# Altium schematic sheet ConnectorSheet-v1.1.SchDoc
size 420 x 297 mm; SheetNumber: 2; SheetTotal: 3
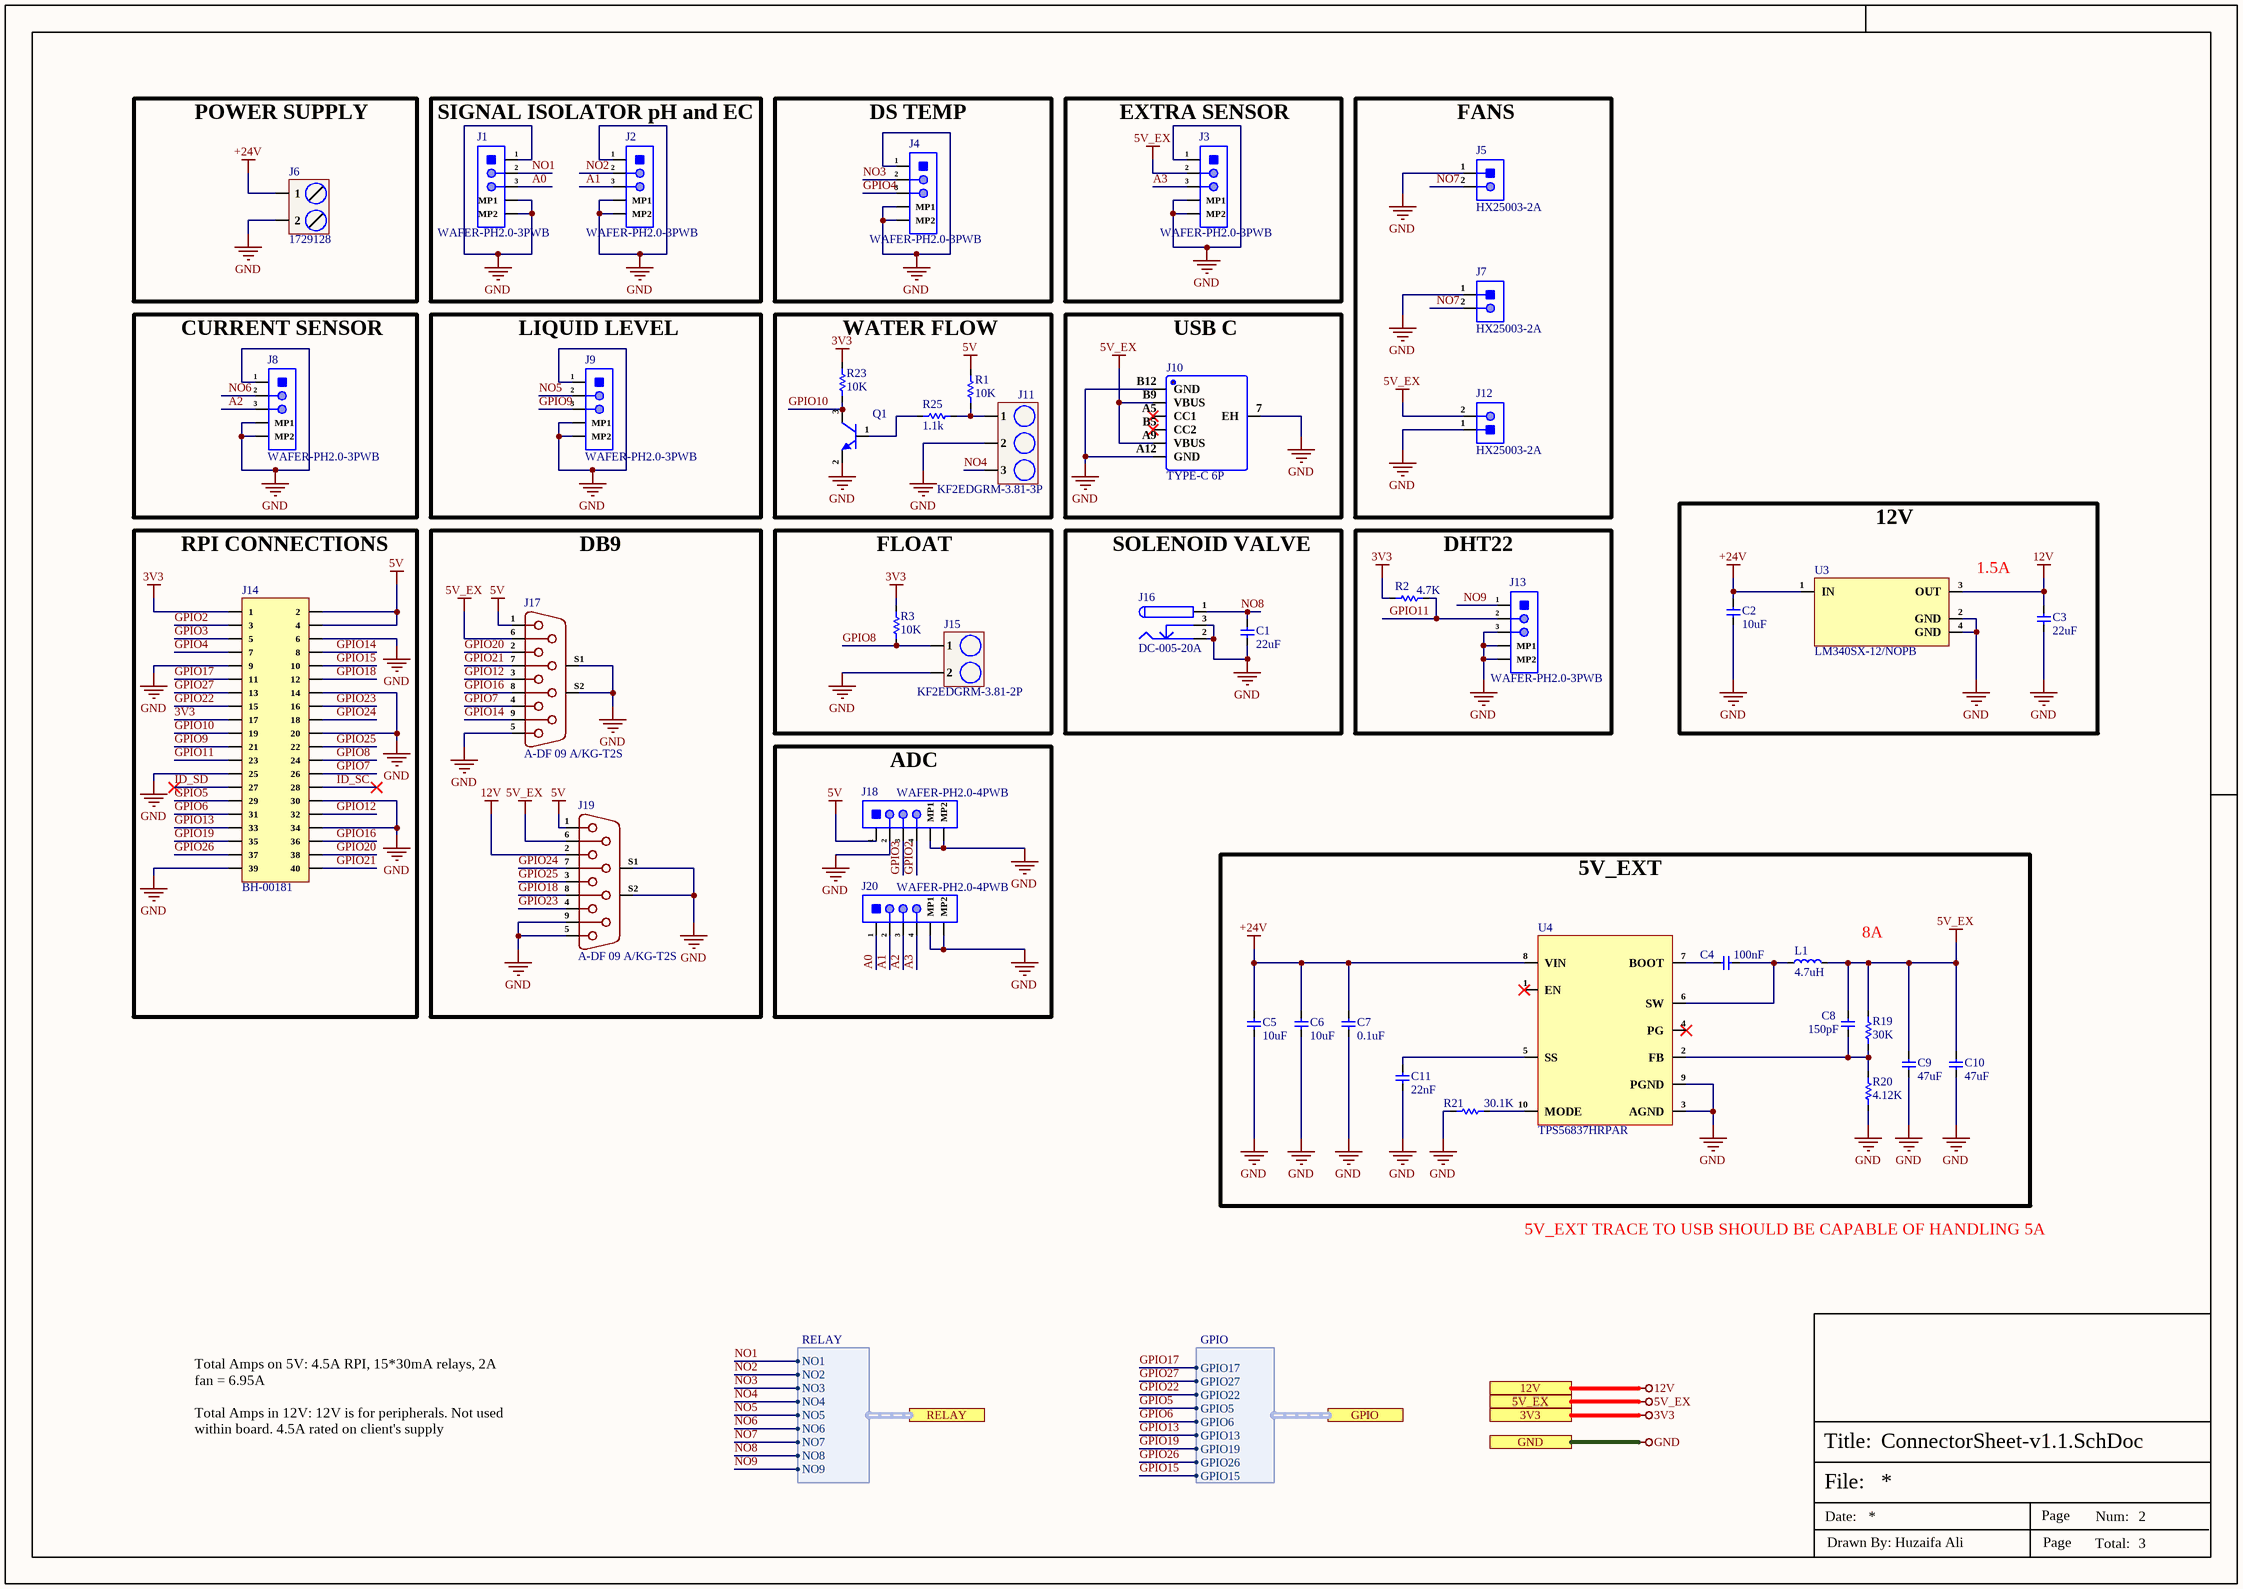
[diagram p0: ConnectorSheet-v1.1.SchDoc]

## Parts
C1  22uF  [Cap-0805]
C2  10uF  [Cap-0805]
C3  22uF  [Cap-0805]
C4  100nF  [cap-0402]
C5  10uF  [Cap-0805]
C6  10uF  [Cap-0805]
C7  0.1uF  [Cap-0402]
C8  150pF  [Cap-0402]
C9  47uF  [Cap-1206]
C10  47uF  [Cap-1206]
C11  22nF  [Cap-0402]
J1  WAFER-PH2.0-3PWB  [WAFER-PH2.0-3PWB]
J2  WAFER-PH2.0-3PWB  [WAFER-PH2.0-3PWB]
J3  WAFER-PH2.0-3PWB  [WAFER-PH2.0-3PWB]
J4  WAFER-PH2.0-3PWB  [WAFER-PH2.0-3PWB]
J5  HX25003-2A  [HX25003-2A]
J6  1729128  [1729128]
J7  HX25003-2A  [HX25003-2A]
J8  WAFER-PH2.0-3PWB  [WAFER-PH2.0-3PWB]
J9  WAFER-PH2.0-3PWB  [WAFER-PH2.0-3PWB]
J10  TYPE-C 6P  [TYPE-C 6P]
J11  KF2EDGRM-3.81-3P  [KF2EDGRM-3.81-3P]
J12  HX25003-2A  [HX25003-2A]
J13  WAFER-PH2.0-3PWB  [WAFER-PH2.0-3PWB]
J14  BH-00181  [BH-00181]
J15  KF2EDGRM-3.81-2P  [KF2EDGRM-3.81-2P]
J16  DC-005-20A  [DC-005-20A]
J17  A-DF 09 A/KG-T2S  [A-DF 09 A/KG-T2S]
J18  WAFER-PH2.0-4PWB  [WAFER-PH2.0-4PWB]
J19  A-DF 09 A/KG-T2S  [A-DF 09 A/KG-T2S]
J20  WAFER-PH2.0-4PWB  [WAFER-PH2.0-4PWB]
L1  4.7uH  [SMD,13.5x12.6mm]
Q1  MMBT2222A-7-F  [SOT-23]  (value not drawn)
R1  10K  [Res-0603]
R2  4.7K  [Res-0603]
R3  10K  [Res-0603]
R19  30K  [Res-0603]
R20  4.12K  [Res-0402]
R21  30.1K  [Res-0402]
R23  10K  [Res-0603]
R25  1.1k  [Res-0603]
U3  LM340SX-12/NOPB  [TO-263 (DDPAK-3)]
U4  TPS56837HRPAR  [10-VQFN-HR (3x3)]

## Blocks framed on the sheet
POWER SUPPLY: J6
SIGNAL ISOLATOR pH and EC: J1 J2
DS TEMP: J4
EXTRA SENSOR: J3
FANS: J5 J7 J12
CURRENT SENSOR: J8
LIQUID LEVEL: J9
WATER FLOW: J11 Q1 R1 R23 R25
USB C: J10
RPI CONNECTIONS: J14
DB9: J17 J19
FLOAT: J15 R3
SOLENOID VALVE: C1 J16
DHT22: J13 R2
12V: C2 C3 U3
ADC: J18 J20
5V_EXT: C4-C11 L1 R19-R21 U4

## Ports
3V3 (see Top-Sheet[2B], RelaySheet-v1.1[4D]), 5V_EX (see Top-Sheet[2B], RelaySheet-v1.1[4D]), 12V (see Top-Sheet[2B], RelaySheet-v1.1[4D]), GND (see Top-Sheet[2B], RelaySheet-v1.1[4D]), GPIO (harness GPIO, see Top-Sheet[2B], RelaySheet-v1.1[4D]), RELAY (harness RELAY, see Top-Sheet[2B], RelaySheet-v1.1[4D])

## Harnesses
GPIO: GPIO17, GPIO27, GPIO22, GPIO5, GPIO6, GPIO13, GPIO19, GPIO26, GPIO15
RELAY: NO2, NO1, NO3, NO4, NO5, NO6, NO7, NO8, NO9

## Nets
3V3: J14.1 J14.17 R2.1 R3.1 R23.1 ; port 3V3
5V: J14.2 J14.4 J17.1 J18.1 J19.1 R1.2
5V_EX: C8.2 C9.2 C10.2 J3.2 J10.A9(VBUS) J10.B9(VBUS) J12.2 J17.6 J19.6 L1.2 R19.2 ; port 5V_EX
12V: C3.2 J19.2 U3.3(OUT) ; port 12V
+24V: C2.2 C5.2 C6.2 C7.2 J6.1 U3.1(IN) U4.8(VIN)
GND: C1.1 C2.1 C3.1 C5.1 C6.1 C7.1 C9.1 C10.1 C11.1 J1.1 J1.MP1 J1.MP2 J2.1 J2.MP1 J2.MP2 J3.1 J3.MP1 J3.MP2 J4.1 J4.MP1 J4.MP2 J5.1 J6.2 J7.1 J8.1 J8.MP1 J8.MP2 J9.1 J9.MP1 J9.MP2 J10.7(EH) J10.A12(GND) J10.B12(GND) J11.2 J12.1 J13.3 J13.MP1 J13.MP2 J14.6 J14.9 J14.14 J14.20 J14.25 J14.30 J14.34 J14.39 J15.2 J16.2 J16.3 J17.5 J17.S1 J17.S2 J18.2 J18.MP1 J18.MP2 J19.5 J19.9 J19.S1 J19.S2 J20.MP1 J20.MP2 Q1.2(E) R20.1 R21.1 U3.2(GND) U3.4(GND) U4.3(AGND) U4.9(PGND) ; port GND
A0: J1.3 J20.1
A1: J2.3 J20.2
A2: J8.3 J20.3
A3: J3.3 J20.4
GPIO2: J14.3 J18.4
GPIO3: J14.5 J18.3
GPIO4: J4.3 J14.7
GPIO5: J14.29 ; port GPIO.GPIO5
GPIO6: J14.31 ; port GPIO.GPIO6
GPIO7: J14.26 J17.4
GPIO8: J14.24 J15.1 R3.2
GPIO9: J9.3 J14.21
GPIO10: J14.19 Q1.3(C) R23.2
GPIO11: J13.2 J14.23 R2.2
GPIO12: J14.32 J17.3
GPIO13: J14.33 ; port GPIO.GPIO13
GPIO14: J14.8 J17.9
GPIO15: J14.10 ; port GPIO.GPIO15
GPIO16: J14.36 J17.8
GPIO17: J14.11 ; port GPIO.GPIO17
GPIO18: J14.12 J19.8
GPIO19: J14.35 ; port GPIO.GPIO19
GPIO20: J14.38 J17.2
GPIO21: J14.40 J17.7
GPIO22: J14.15 ; port GPIO.GPIO22
GPIO23: J14.16 J19.4
GPIO24: J14.18 J19.7
GPIO25: J14.22 J19.3
GPIO26: J14.37 ; port GPIO.GPIO26
GPIO27: J14.13 ; port GPIO.GPIO27
ID_SC: J14.28
ID_SD: J14.27
NO1: J1.2 ; port RELAY.NO1
NO2: J2.2 ; port RELAY.NO2
NO3: J4.2 ; port RELAY.NO3
NO4: J11.3 ; port RELAY.NO4
NO5: J9.2 ; port RELAY.NO5
NO6: J8.2 ; port RELAY.NO6
NO7: J5.2 J7.2 ; port RELAY.NO7
NO8: C1.2 J16.1 ; port RELAY.NO8
NO9: J13.1 ; port RELAY.NO9
NetC4_1: C4.1 U4.7(BOOT)
NetC4_2: C4.2 L1.1 U4.6(SW)
NetC8_1: C8.1 R19.1 R20.2 U4.2(FB)
NetC11_2: C11.2 U4.5(SS)
NetJ11_1: J11.1 R1.1 R25.1
NetQ1_1: Q1.1(B) R25.2
NetR21_2: R21.2 U4.10(MODE)

Not connected (* = marked no-connect by the designer): J10 A5(CC1)* B5(CC2)*; U4 1(EN)* 4(PG)*

## Notes on the sheet
- 1.5A
- (near L1) 8A
- 5V_EXT TRACE TO USB SHOULD BE CAPABLE OF HANDLING 5A
- Total Amps on 5V: 4.5A RPI, 15*30mA relays, 2A fan = 6.95A
  Total Amps in 12V: 12V is for peripherals. Not used within board. 4.5A rated on client's supply
- File:
- Title:
- Date:
- Page
- Num:
- Total:
- Drawn By: Huzaifa Ali

## Library data of the parts
C1 C3 = C2012X5R1V226MT000E: CAP CER 22UF 35V X5R 0805; Manufacturer: TDK Corporation; Item Type: Capacitor; Manufacturer Part Number: C2012X5R1V226MT000E; Package: 0805; ComponentLink1Description: LCSC; ComponentLink1URL: https://www.lcsc.com/product-detail/Multilayer-Ceramic-Capacitors-MLCC-SMD-SMT_TDK-C2012X5R1V226M125AC_C2179409.html; LCSC Part Number: C338080
C2 C5 C6 = GRM21BR61H106ME43L: CAP CER 10UF 50V X5R 0805; Manufacturer: Murata; Supplier 1: Digi-Key; Manufacturer Part Number: GRM21BR61H106ME43L; RoHS: Yes; Category: Ceramic Capacitors; Stock 1: 26; Pricing 1: 1=0.44000, 10=0.30700, 50=0.21500, 100=0.18420, 500=0.13818, 1000=0.11668 (USD); Supplier Part Number 1: 490-18664-1-ND; LCSC Part Number: C2190942
C4 = C1005X7R1H104KT000F: CAP CER 0.1UF 50V X7R 0402; Manufacturer: TDK; Tolerance: 10%; Voltage: 25V; Item Type: Capacitor; Supplier 1: Avnet; Manufacturer Part Number: C1005X7R1H104KT000F; RoHS: No; Category: Ceramic Capacitors; Dielectric: X7R; Supplier Part Number 1: C1005X7R1H104KT000F; LCSC Part Number: C361198; ComponentLink1Description: LCSC; ComponentLink1URL: https://www.lcsc.com/product-detail/Multilayer-Ceramic-Capacitors-MLCC-SMD-SMT_TDK-C1005X7R1H104KT000F_C361198.html
C7 = C1005X5R1H104K050BB: CAP CER 0.1UF 50V X5R 0402; Manufacturer: TDK; Dielectric Material: Ceramic; Capacitance: 100nF; Tolerance: 10%; Item Type: Capacitor; Supplier 1: Digi-Key; Manufacturer Part Number: C1005X5R1H104K050BB; Stock 1: 1455182; Pricing 1: 1=0.12, 10=0.09, 50=0.049, 100=0.04, 500=0.02858, 1000=0.02245, 2500=0.02041, 5000=0.01878 (USD); Mount: Surface Mount; Case/Package: 0402; Case Code (Metric): 1005; Case Code (Imperial): 0402; Weight: 2.3E-05oz; Min Operating Temperature: -55°C; Max Operating Temperature: 85°C; Dielectric: X5R; Voltage Rating: 50V; Packaging: Tape and Reel; Voltage Rating (DC): 50V; Termination: SMD/SMT; Construction: Flat; Package Quantity: 1; Resistor Type: Ceramic; Voltage: 50V; Series: C; Length: 1mm; Width: 0.02inch; Height: 0.5mm; Depth: 0.5mm; Thickness: 0.022inch; Radiation Hardening: No; Lead Free: Lead Free; REACH SVHC: No SVHC; RoHS Compliant: Yes; ComponentLink1URL: https://product.tdk.com/info/en/catalog/spec/mlccspec_commercial_general_midvoltage_en.pdf?src-supplier=Digi-Key; ComponentLink1Description: https://product.tdk.com/info/en/catalog/spec/mlccspec_commercial_general_midvoltage_en.pdf?src-supplier=Digi-Key; ComponentLink2URL: http://www.tdk.co.jp/tefe02/e413_c.pdf?src-supplier=Future+Electronics; ComponentLink2Description: http://www.tdk.co.jp/tefe02/e413_c.pdf?src-supplier=Future+Electronics; ComponentLink3URL: https://www.verical.com/server-webapp/html/getDatasheet?partID=743571&src-supplier=Verical; ComponentLink3Description: https://www.verical.com/server-webapp/html/getDatasheet?partID=743571&src-supplier=Verical; ComponentLink4URL: http://www.tdk.co.jp/tefe02/e412_c.pdf?src-supplier=Avnet+Europe; ComponentLink4Description: http://www.tdk.co.jp/tefe02/e412_c.pdf?src-supplier=Avnet+Europe; Supplier Part Number 1: 445-5942-1-ND; LCSC Part Number: C2181865
C8 = CC0402KRX7R8BB151: CAP CER 150PF 25V X7R 0402; Manufacturer: Yageo; Tolerance: 10%; Item Type: Capacitor; Supplier: Future Electronics; Supplier Part Number: 2069488; Manufacturer Part Number: CC0402KRX7R8BB151; RoHS: Yes; Category: Ceramic Capacitors; Stock: 40000; Pricing: 10000=0.0032, 40000=0.003, 150000=0.0029, 400000=0.0028, 1000000=0.0026 (USD); Mounting Technology: Surface Mount; Case/Package: 0402; Case Code (Imperial): 0402; Case Code (Metric): 1005; Weight: 2.3E-05oz; Min Operating Temperature: -55°C; Max Operating Temperature: 125°C; Value: 150pF; Packaging: Tape and Reel; Voltage Rating (DC): 25V; Dielectric: X7R; Voltage Rating: 25V; Termination: SMD/SMT; Series: CC; Length: 0.039inch; Width: 0.02inch; Thickness: 0.022inch; Lead Free: Lead Free; Halogen Free: Halogen Free; RoHS Compliant: Yes; ComponentLink1URL: https://datasheet.ciiva.com/13210/upy-gphc-x7r-6-3v-to-50v-8-12304-13210062.pdf?src-supplier=Mouser; ComponentLink1Description: https://datasheet.ciiva.com/13210/upy-gphc-x7r-6-3v-to-50v-8-12304-13210062.pdf?src-supplier=Mouser; LCSC Part Number: C541384
C9 C10 = C3216X5R1E476M160AC: CAP CER 47UF 25V X5R 1206; Manufacturer: TDK; Dielectric Material: Ceramic; Tolerance: 20%; Supplier 1: Digi-Key; Manufacturer Part Number: C3216X5R1E476M160AC; Stock 1: 886163; Pricing 1: 1=1.09, 10=0.862, 50=0.7476, 100=0.6469, 500=0.48876, 1000=0.43125 (USD); Mount: Surface Mount; Case/Package: 1206; Case Code (Metric): 3216; Case Code (Imperial): 1206; Weight: 0.000571oz; Min Operating Temperature: -55°C; Max Operating Temperature: 85°C; Capacitance: 47uF; Voltage Rating: 25V; Packaging: Tape and Reel; Voltage Rating (DC): 25V; Termination: SMD/SMT; Series: C; Package Quantity: 1; Dielectric: X5R; Resistor Type: Ceramic; Voltage: 25V; Length: 0.126inch; Width: 0.063inch; Height: 1.6mm; Depth: 1.6mm; Thickness: 0.071inch; Lead Free: Lead Free; REACH SVHC: No SVHC; ComponentLink1URL: https://product.tdk.com/info/en/catalog/datasheets/mlcc_commercial_general_en.pdf?src-supplier=Digi-Key; ComponentLink1Description: https://product.tdk.com/info/en/catalog/datasheets/mlcc_commercial_general_en.pdf?src-supplier=Digi-Key; ComponentLink2URL: https://product.tdk.com/info/en/documents/chara_sheet/C3216X5R1E476M160AC.pdf?src-supplier=Digi-Key; ComponentLink2Description: https://product.tdk.com/info/en/documents/chara_sheet/C3216X5R1E476M160AC.pdf?src-supplier=Digi-Key; ComponentLink3URL: http://www.tdk.com/pdf/general_B11.pdf?src-supplier=Future+Electronics; ComponentLink3Description: http://www.tdk.com/pdf/general_B11.pdf?src-supplier=Future+Electronics; Supplier Part Number 1: 445-8047-1-ND; LCSC Part Number: C2167787
C11 = CC0402KRX5R7BB223: CAP CER 0.022UF 16V X5R 0402; Manufacturer: Yageo; Tolerance: 10%; Supplier 1: Mouser; Manufacturer Part Number: CC0402KRX5R7BB223; RoHS: Yes; Category: Ceramic Capacitors; Stock 1: 31160; Pricing 1: 1=0.10000, 10=0.05600, 50=0.05600, 100=0.02500, 1000=0.01400, 10000=0.01000 (USD); Mount: Surface Mount; Case/Package: 0402; Case Code (Metric): 1005; Case Code (Imperial): 0402; Min Operating Temperature: -55°C; Max Operating Temperature: 85°C; Packaging: Tape and Reel; Capacitance: 22nF; Voltage Rating: 16V; Voltage Rating (DC): 16V; Dielectric: X5R; Length: 0.039inch; Width: 0.02inch; Thickness: 0.022inch; Lead Free: Lead Free; Halogen Free: Halogen Free; RoHS Compliant: Yes; ComponentLink1URL: http://www.yageo.com/exep/pages/download/literatures/ProductSelectionGuide%202014_Final_2.pdf?src-supplier=Digi-Key; ComponentLink1Description: http://www.yageo.com/exep/pages/download/literatures/ProductSelectionGuide%202014_Final_2.pdf?src-supplier=Digi-Key; ComponentLink2URL: http://www.yageo.com/documents/recent/UPY-GPHC_X5R_4V-to-50V_25.pdf?src-supplier=Digi-Key; ComponentLink2Description: http://www.yageo.com/documents/recent/UPY-GPHC_X5R_4V-to-50V_25.pdf?src-supplier=Digi-Key; Supplier Part Number 1: 603-CC402KRX5R7BB223; LCSC Part Number: C541399
J1-J4 J8 J9 J13 = WAFER-PH2.0-3PWB: 1x3P 3P 1 2mm 3 -25℃~+85℃ 2A Surface Mount，Right Angle SMD,P=2mm,Surface Mount，Right Angle Wire To Board Connector ROHS; Manuacturer: XUNPU; Manufacturer Part Number: WAFER-PH2.0-3PWB; LCSC Part Number: C3029441; Item Type: Connector; ComponentLink1Description: LCSC; ComponentLink1URL: https://www.lcsc.com/product-detail/Wire-To-Board-Connector_XUNPU-WAFER-PH2-0-3PWB_C3029441.html
J5 J7 J12 = HX25003-2A: 1x2P 2P XH 1 2.5mm 2 Straight Plugin,P=2.5mm Wire To Board Connector ROHS; Manufacturer: HX; Manufacturer Part Number: HX25003-2A; Package: Plugin,P=2.5mm; LCSC Part Number: C442299; Item Type: Wire To Board Connector; ComponentLink1Description: LCSC; ComponentLink1URL: https://www.lcsc.com/product-detail/Wire-To-Board-Connector_HX-Zhejiang-Yueqing-Hongxing-Elec-HX25003-2A_C442299.html
J6 = 1729128: TERM BLK 2P SIDE ENT 5.08MM PCB; Manufacturer: Phoenix Contact; Item Type: Terminal Blocks; Voltage Rating: 400V; Number of Poles: 2; Current Rating: 13.5A; Number of Levels: 1; Current: 10A; Voltage: 300V; Connector Type: Screw; Wire Gauge (Max): 26AWG; Wire Gauge (Min): 14AWG; Approvals: UL,CSA; Supplier: Digikey; Supplier Part Number: 277-1247-ND; Manufacturer Part Number: 1729128; RoHS: Yes; Stock: 33086; Pricing: 1=0.77 (USD); Mounting Technology: Through Hole; Pins: 2; Color: Green; Housing Color: Green; Housing Material: Polyamide; Weight: 0.069842oz; Insulation Material: Nylon; Contact Material: Tin; Package Quantity: 50; Packaging: Bulk; Termination: Solder; Series: MKDSN; Number of Positions Per Level: 2; Number of Positions: 2; Orientation: Straight; Max Current Rating: 13.5A; Number of Rows: 1; Max Supply Voltage: 400V; Number of Contacts: 2; Number of Circuits: 2; Length: 8.1mm; Width: 13.5mm; Height: 13.5mm; Depth: 8.1mm; Pitch: 5.08mm; Wire/Cable Gauge: 26AWG; Radiation Hardening: No; RoHS Compliant: Yes; Lead Free: Lead Free; Flammability Rating: UL94 V-0; Reach SVHC Compliant: No; ComponentLink1URL: https://datasheet.ciiva.com/16046/1729128-16046181.pdf?src-supplier=Onlinecomponents.com; ComponentLink1Description: https://datasheet.ciiva.com/16046/1729128-16046181.pdf?src-supplier=Onlinecomponents.com; ComponentLink2URL: https://datasheet.ciiva.com/15169/getdatasheetpartid-199310-15169845.pdf?src-supplier=Verical; ComponentLink2Description: https://datasheet.ciiva.com/15169/getdatasheetpartid-199310-15169845.pdf?src-supplier=Verical; ComponentLink3URL: https://datasheet.ciiva.com/823/1729128-823779.pdf?src-supplier=Digikey; ComponentLink3Description: https://datasheet.ciiva.com/823/1729128-823779.pdf?src-supplier=Digikey; ComponentLink4URL: https://datasheet.ciiva.com/14607/70054405-14607157.pdf?src-supplier=Allied+Electronics; ComponentLink4Description: https://datasheet.ciiva.com/14607/70054405-14607157.pdf?src-supplier=Allied+Electronics; ComponentLink5URL: https://datasheet.ciiva.com/29218/743664-da-01-en-printklemmenblock-mkdsn-1-5-2-5-08-29218154.pdf?src-supplier=Conrad; ComponentLink5Description: https://datasheet.ciiva.com/29218/743664-da-01-en-printklemmenblock-mkdsn-1-5-2-5-08-29218154.pdf?src-supplier=Conrad; LCSC Part Number: C7509570
J10 = TYPE-C 6P: 1 Surface Mount，Right Angle 6P Female -40℃~+85℃ Type-C SMD USB Connectors ROHS; Manufacturer: SHOU HAN; Manufacturer Part Number: TYPE-C 6P; Package: SMD; LCSC Part Number: C456012; Item Type: Type-C SMD; ComponentLink1Description: LCSC; ComponentLink1URL: https://www.lcsc.com/product-detail/USB-Connectors_SHOU-HAN-TYPE-C-6P_C456012.html
J11 = KF2EDGRM-3.81-3P: 300V 8A 3 Bend -40℃~+105℃ 1 3.81mm 1x3P Green Board Edge/Receptacle-Close Screw fixed Push-Pull,P=3.81mm Pluggable System Terminal Block ROHS; Manufacturer: Cixi Kefa Elec; Manufacturer Part Number: KF2EDGRM-3.81-3P; Package: Push-Pull,P=3.81mm; LCSC Part Number: C441269; Item Type: Terminal Block; ComponentLink1Description: LCSC; ComponentLink1URL: https://www.lcsc.com/product-detail/Pluggable-System-Terminal-Block_Cixi-Kefa-Elec-KF2EDGRM-3-81-3P_C441269.html
J14 = BH-00181: 2.54mm -40℃~+105℃ Brick nogging 3A 2x20P 20 Push - Pull 2.54mm 2 SMD,P=2.54mm IDC Connectors ROHS; Manufacturer: Liansheng; Manufacturer Part Number: BH-00181; Package: SMD,P=2.54mm; LCSC Part Number: C2685075; Item Type: IDC Connector; ComponentLink1Description: LCSC; ComponentLink1URL: https://www.lcsc.com/product-detail/IDC-Connectors_Liansheng-BH-00181_C2685075.html
J15 = KF2EDGRM-3.81-2P: 300V 8A 2 Bend -40℃~+105℃ 1 3.81mm 1x2P Green Board Edge/Receptacle-Close Screw fixed Push-Pull,P=3.81mm Pluggable System Terminal Block ROHS; Manufacturer: Cixi Kefa Elec; Manufacturer Part Number: KF2EDGRM-3.81-2P; Package: Push-Pull,P=3.81mm; LCSC Part Number: C441268; Item Type: Terminal Block; ComponentLink1Description: LCSC; ComponentLink1URL: https://www.lcsc.com/product-detail/Pluggable-System-Terminal-Block_Cixi-Kefa-Elec-KF2EDGRM-3-81-2P_C441268.html
J16 = DC-005-20A: 2mm 6.4mm 500mA 30V Plugin DC Power Connector ROHS; Manufacturer: Korean Hroparts Elec; Manufacturer Part Number: DC-005-20A; Package: Plugin; LCSC Part Number: C136744; Item Type: DC Power Connector; ComponentLink1Description: LCSC; ComponentLink1URL: https://www.lcsc.com/product-detail/DC-Power-Connector_Korean-Hroparts-Elec-DC-005-20A_C136744.html
J17 J19 = A-DF 09 A/KG-T2S: CONN D-SUB RCPT 9POS R/A SLDR; Manufacturer: Assmann; Item Type: D-Sub Connectors; Number of Contacts: 9NUMBER; Supplier: Digikey; Supplier Part Number: AE10921-ND; Manufacturer Part Number: A-DF 09 A/KG-T2S; RoHS: Yes; Stock: 23990; Pricing: 1=0.78, 10=0.661, 25=0.6336, 40=0.62025, 90=0.59322, 270=0.53933, 450=0.4854, 990=0.43147, 2430=0.39102 (USD); Height: 12.68mm; Lead Free: 5697LeadFree; ComponentLink1URL: https://datasheet.ciiva.com/26927/getdatasheetpartid-755627-26927441.pdf?src-supplier=Verical; ComponentLink1Description: https://datasheet.ciiva.com/26927/getdatasheetpartid-755627-26927441.pdf?src-supplier=Verical
J18 J20 = WAFER-PH2.0-4PWB: 1x4P 1 2mm Male pin 4 -25℃~+85℃ 2A Surface Mount SMD,P=2mm Wire To Board / Wire To Wire Connector ROHS / C3029442; Manuacturer: XUNPU; Manufacturer Part Number: WAFER-PH2.0-4PWB; LCSC Part Number: C3029442; Item Type: Connector; ComponentLink1Description: LCSC; ComponentLink1URL: https://www.lcsc.com/product-detail/Wire-To-Board-Wire-To-Wire-Connector_XUNPU-WAFER-PH2-0-4PWB_C3029442.html
L1 = MWSA1206S-4R7MT: 15A 4.7uH ±20% 24A SMD,13.5x12.6mm Power Inductors ROHS; Manufacturer: Sunlord; Supplier: Digikey; Supplier Part Number: 3442-MWSA1206S-4R7MTCT-ND; Manufacturer Part Number: MWSA1206S-4R7MT; RoHS: No; Item Type: Inductors; Stock: 195; Pricing: 1=1.67, 10=1.417, 25=1.3056, 50=1.1666, 100=0.9721, 250=0.94436 (USD); LCSC Part Number: C408521
Q1 = MMBT2222A-7-F: TRANS NPN 40V 0.6A SMD SOT23-3; Manufacturer: Diodes; Max Power Dissipation: 300mW; Collector Base Voltage (VCBO): 75V; Max Collector Current: 600mA; hFE Min: 100; Frequency: 300MHz; Number of Elements: 1; Emitter Base Voltage (VEBO): 6V; Collector Emitter Saturation Voltage: 1V; Power Dissipation: 350mW; Element Configuration: Single; Current: 1A; Item Type: Mosfet; Supplier 1: Digi-Key; Manufacturer Part Number: MMBT2222A-7-F; Stock 1: 2471182; Pricing 1: 1=0.15, 10=0.134, 100=0.0729, 500=0.04486, 1000=0.03059 (USD); Mount: Surface Mount; Case/Package: SOT-23; Number of Pins: 3; Weight: 0.000282oz; Contact Plating: Matte,Tin; Min Operating Temperature: -55°C; Max Operating Temperature: 150°C; Packaging: Tape and Reel; Collector Emitter Voltage (VCEO): 40V; Polarity: NPN; Voltage Rating (DC): 40V; Package Quantity: 3000; Continuous Collector Current: 600mA; Collector Emitter Breakdown Voltage: 40V; Transition Frequency: 300MHz; Max Breakdown Voltage: 40V; Max Frequency: 300MHz; Termination: SMD/SMT; Gain Bandwidth Product: 300MHz; Current Rating: 600mA; Voltage: 40V; Length: 3.05mm; Height: 1mm; Width: 1.4mm; Radiation Hardening: No; Lead Free: Lead Free; REACH SVHC: No SVHC; ComponentLink1URL: http://www.diodes.com/datasheets/ds30041.pdf?src-supplier=Future+Electronics; ComponentLink1Description: http://www.diodes.com/datasheets/ds30041.pdf?src-supplier=Future+Electronics; ComponentLink2URL: http://www.diodes.com/datasheets/ds30041.pdf?src-supplier=Avnet; ComponentLink2Description: http://www.diodes.com/datasheets/ds30041.pdf?src-supplier=Avnet; ComponentLink3URL: https://www.verical.com/server-webapp/html/getDatasheet?partID=82692&src-supplier=Verical; ComponentLink3Description: https://www.verical.com/server-webapp/html/getDatasheet?partID=82692&src-supplier=Verical; ComponentLink4URL: https://www.diodes.com/assets/Datasheets/ds30041.pdf?src-supplier=Digi-Key; ComponentLink4Description: https://www.diodes.com/assets/Datasheets/ds30041.pdf?src-supplier=Digi-Key; ComponentLink5URL: http://www.diodes.com/datasheets/ds30041.pdf?src-supplier=Avnet+Europe; ComponentLink5Description: http://www.diodes.com/datasheets/ds30041.pdf?src-supplier=Avnet+Europe; ComponentLink6URL: http://www.diodes.com/datasheets/ds30041.pdf?src-supplier=Element14; ComponentLink6Description: http://www.diodes.com/datasheets/ds30041.pdf?src-supplier=Element14; Supplier Part Number 1: MMBT2222A-FDIDKR-ND; LCSC Part Number: C94515
R1 R23 = RK73G1JTTD1002F: RES 10K OHM 1% 1/10W 0603; Item Type: Resistor; Value: 10kR; Power Rating: 100mW; Voltage Rating: 75V; Temperature Coefficient: 50ppm/°C; LCSC Part Number: C362180; ComponentLink1Description: LCSC; Supplier: Digi-Key; Supplier Part Number: 2019-RK73G1JTTD1002FCT-ND; RoHS: Yes; Category: Chip SMD Resistors; Stock: 249394; Pricing: 1=0.22, 10=0.118, 50=0.0812, 100=0.0699, 500=0.0513, 1000=0.04545 (USD); Case/Package: 0603; Case Code (Imperial): 0603; Case Code (Metric): 1608; Min Operating Temperature: -55°C; Max Operating Temperature: 125°C; Tolerance: 1%; Packaging: Tape and Reel; Termination: SMD/SMT; Series: RK73G; Construction: Rectangular; Length: 1.6mm; Depth: 0.8mm; Military Standard: Not; RoHS Compliant: Yes; ComponentLink2URL: http://www.mouser.com/ds/2/219/RK73G-9863.pdf?src-supplier=Mouser; ComponentLink2Description: http://www.mouser.com/ds/2/219/RK73G-9863.pdf?src-supplier=Mouser
R2 = RC0603FR-074K7L: RES SMD 4.7K OHM 1% 1/10W 0603; Manufacturer: Yageo; Item Type: Resistor; Manufacturer Part Number: RC0603FR-074K7L; Package: 0603; ComponentLink7Description: LCSC; ComponentLink7URL: https://www.lcsc.com/product-detail/Chip-Resistor-Surface-Mount_YAGEO-RC0603FR-074K7L_C99782.html; LCSC Part Number: C99782
R3 = 0603WAF1002T5E: 100mW Thick Film Resistors 75V ±100ppm/℃ ±1% 10kΩ 0603 Chip Resistor - Surface Mount ROHS; Manufacturer: UNI-ROYAL(Uniroyal Elec); Manufacturer Part Number: 0603WAF1002T5E; Value: 10K; Package: 0603; ComponentLink1Description: LCSC; ComponentLink1URL: https://www.lcsc.com/product-detail/Chip-Resistor-Surface-Mount_UNI-ROYAL-Uniroyal-Elec-0603WAF1002T5E_C25804.html; LCSC Part Number: C25804; Item Type: Resistor
R19 = RC0603FR-0730KL: RES 30K OHM 1% 1/10W 0603; Supplier 1: Digi-Key; Supplier Part Number 1: 311-30.0KHRCT-ND; LCSC Part Number: C100001
R20 = CRCW04024K12FKED: RES SMD 4.12K OHM 1% 1/16W 0402; Manufacturer: Vishay; Item Type: Resistor; Value: 4.12kR; Power Rating: 63mW; Temperature Coefficient: 100ppm/°C; Voltage Rating: 50V; Supplier: Mouser; Supplier Part Number: 71-CRCW0402-4.12K-E3; Manufacturer Part Number: CRCW04024K12FKED; RoHS: Yes; Stock: 17765; Pricing: 1=0.1, 10=0.017, 50=0.017, 100=0.01, 1000=0.008, 10000=0.004 (USD); Case/Package: 0402; Pins: 2; Weight: 2.3E-05oz; Case Code (Metric): 1005; Case Code (Imperial): 0402; Contact Plating: Tin; Min Operating Temperature: -55°C; Max Operating Temperature: 155°C; Tolerance: 1%; Package Quantity: 10000; Packaging: Tape and Reel; Number of Terminations: 2; Max Power Dissipation: 63mW; Features: Automotive AEC-Q200; Series: CRCW; Resistor Type: Thick Film; Termination: SMD/SMT; Voltage Rating (DC): 50V; Resistance Tolerance: 1%; Technology: THICK FILM; Length: 1mm; Width: 0.5mm; Height: 0.35mm; Depth: 0.5mm; Ratings: AEC-Q200; Radiation Hardening: No; Lead Free: Lead Free; RoHS Compliant: Yes; Reach SVHC Compliant: Unknown; ComponentLink1URL: https://datasheet.ciiva.com/11818/0900766b80d98824-11818084.pdf?src-supplier=Rs; ComponentLink1Description: https://datasheet.ciiva.com/11818/0900766b80d98824-11818084.pdf?src-supplier=Rs; ComponentLink2URL: https://datasheet.ciiva.com/9074/dcrcwe3-9074703.pdf?src-supplier=Avnet; ComponentLink2Description: https://datasheet.ciiva.com/9074/dcrcwe3-9074703.pdf?src-supplier=Avnet; ComponentLink3URL: https://datasheet.ciiva.com/7679/1533075-7679254.pdf?src-supplier=Element14; ComponentLink3Description: https://datasheet.ciiva.com/7679/1533075-7679254.pdf?src-supplier=Element14; ComponentLink4URL: https://datasheet.ciiva.com/2463/dcrcwe3-2463731.pdf?src-supplier=Digikey; ComponentLink4Description: https://datasheet.ciiva.com/2463/dcrcwe3-2463731.pdf?src-supplier=Digikey; ComponentLink5URL: https://datasheet.ciiva.com/2463/dcrcwe3-2463732.pdf?src-supplier=Digikey; ComponentLink5Description: https://datasheet.ciiva.com/2463/dcrcwe3-2463732.pdf?src-supplier=Digikey; ComponentLink6URL: https://datasheet.ciiva.com/2463/dcrcwe3-2463730.pdf?src-supplier=Digikey; ComponentLink6Description: https://datasheet.ciiva.com/2463/dcrcwe3-2463730.pdf?src-supplier=Digikey; ComponentLink7URL: https://datasheet.ciiva.com/16758/70201119-16758669.pdf?src-supplier=Allied+Electronics; ComponentLink7Description: https://datasheet.ciiva.com/16758/70201119-16758669.pdf?src-supplier=Allied+Electronics; ComponentLink8URL: https://datasheet.ciiva.com/22871/70201119-22871725.pdf?src-supplier=Allied+Electronics; ComponentLink8Description: https://datasheet.ciiva.com/22871/70201119-22871725.pdf?src-supplier=Allied+Electronics
R21 = RT0402BRD0730K1L: RES SMD 30.1KOHM 0.1% 1/16W 0402; Manufacturer: Yageo; Item Type: Resistor; Supplier: Rs; Supplier Part Number: 1991324P; Manufacturer Part Number: RT0402BRD0730K1L; RoHS: Yes; Category: Chip SMD Resistors; Stock: 7420; Pricing: 100=0.138, 250=0.115, 500=0.092, 1000=0.076 (GBP); ComponentLink1URL: https://datasheet.ciiva.com/12722/pyu-rt-1-to-0-05-rohs-l-4-12722119.pdf?src-supplier=Mouser; ComponentLink1Description: https://datasheet.ciiva.com/12722/pyu-rt-1-to-0-05-rohs-l-4-12722119.pdf?src-supplier=Mouser; ComponentLink2URL: https://datasheet.ciiva.com/2582/pyu-rt-1-to-0-05-rohs-l-5-2582303.pdf?src-supplier=Digi-Key; ComponentLink2Description: https://datasheet.ciiva.com/2582/pyu-rt-1-to-0-05-rohs-l-5-2582303.pdf?src-supplier=Digi-Key; LCSC Part Number: C852714
R25 = RT0603BRD071K1L: RES SMD 1.1K OHM 0.1% 1/10W 0603; Manufacturer: Yageo; Resistance: 1.1kR; Temperature Coefficient: 25ppm/°C; Power Rating: 100mW; Voltage Rating: 75V; Voltage Rating (DC): 50V; Item Type: Resistor; Supplier 1: Rs; Manufacturer Part Number: RT0603BRD071K1L; RoHS: Yes; Category: Chip SMD Resistors; Stock 1: 7030; Pricing 1: 10=0.23500, 100=0.21900, 250=0.20400, 500=0.19000, 1000=0.17400 (GBP); Case/Package: 0603; Contact Plating: Tin,Matte; Case Code (Metric): 1608; Case Code (Imperial): 0603; Min Operating Temperature: -55°C; Max Operating Temperature: 125°C; Tolerance: 0.1%; Resistor Type: Thin Film; Package Quantity: 5000; Packaging: Tape and Reel; Number of Terminations: 2; Termination: SMD/SMT; Max Power Dissipation: 100mW; Features: Moisture Resistant; Series: RT; Length: 0.063inch; Width: 0.031inch; Height: 0.022inch; Radiation Hardening: No; Lead Free: Lead Free; RoHS Compliant: Yes; ComponentLink1URL: https://datasheet.ciiva.com/12725/pyu-rt-1-to-0-05-rohs-l-4-12725819.pdf?src-supplier=Mouser; ComponentLink1Description: https://datasheet.ciiva.com/12725/pyu-rt-1-to-0-05-rohs-l-4-12725819.pdf?src-supplier=Mouser; ComponentLink2URL: https://datasheet.ciiva.com/2585/pyu-rt-1-to-0-05-rohs-l-4-2585740.pdf?src-supplier=Digi-Key; ComponentLink2Description: https://datasheet.ciiva.com/2585/pyu-rt-1-to-0-05-rohs-l-4-2585740.pdf?src-supplier=Digi-Key; ComponentLink3URL: https://datasheet.ciiva.com/8895/pyu-rt-1-to-0-05-rohs-l-4-8895949.pdf?src-supplier=Avnet; ComponentLink3Description: https://datasheet.ciiva.com/8895/pyu-rt-1-to-0-05-rohs-l-4-8895949.pdf?src-supplier=Avnet; LCSC Part Number: C705736; Supplier Part Number 1: 1991436
U3 = LM340SX-12/NOPB: IC REG LIN 12V 1.5A DDPAK/TO263; Manufacturer: TI National Semiconductor; Supplier: Mouser; Supplier Part Number: 926-LM340SX-12/NOPB; Manufacturer Part Number: LM340SX-12/NOPB; RoHS: Yes; Item Type: IC; Stock: 1516; Pricing: 1=1.86, 10=1.59, 50=1.59, 100=1.34, 1000=0.921, 10000=0.794 (USD); ComponentLink1URL: https://datasheet.ciiva.com/15111/getdatasheetpartid-88734-15111564.pdf?src-supplier=Verical; ComponentLink1Description: https://datasheet.ciiva.com/15111/getdatasheetpartid-88734-15111564.pdf?src-supplier=Verical; ComponentLink2URL: https://datasheet.ciiva.com/27051/1271515-27051800.pdf?src-supplier=Jameco; ComponentLink2Description: https://datasheet.ciiva.com/27051/1271515-27051800.pdf?src-supplier=Jameco; ComponentLink3URL: https://datasheet.ciiva.com/41458/001014071-da-01-en-ic-reg-ldo-lm340sx-12-nopb-to-263-3-tid-41458271.pdf?src-supplier=Conrad; ComponentLink3Description: https://datasheet.ciiva.com/41458/001014071-da-01-en-ic-reg-ldo-lm340sx-12-nopb-to-263-3-tid-41458271.pdf?src-supplier=Conrad; ComponentLink4URL: https://datasheet.ciiva.com/3225/lm340-n-3225397.pdf?src-supplier=Avnet; ComponentLink4Description: https://datasheet.ciiva.com/3225/lm340-n-3225397.pdf?src-supplier=Avnet; ComponentLink5URL: https://datasheet.ciiva.com/6582/lm340-n-6582405.pdf?src-supplier=Digikey; ComponentLink5Description: https://datasheet.ciiva.com/6582/lm340-n-6582405.pdf?src-supplier=Digikey; ComponentLink6URL: https://datasheet.ciiva.com/6582/lm340-n-6582409.pdf?src-supplier=Digikey; ComponentLink6Description: https://datasheet.ciiva.com/6582/lm340-n-6582409.pdf?src-supplier=Digikey
U4 = TPS56837HRPAR: 4.5V TO 28V INPUT, 8A SYNCHRONOU; Manufacturer: Texas Instruments; Item Type: IC; Supplier: Mouser; Supplier Part Number: 595-TPS56837HRPAR; Manufacturer Part Number: TPS56837HRPAR; RoHS: No; Stock: 4990; Pricing: 1=2.74, 10=2.46, 50=2.46, 100=1.97, 1000=1.34, 10000=1.2 (USD); Pins: 10; Length: 3mm; Width: 3mm; Height: 1mm; Thickness: 900um